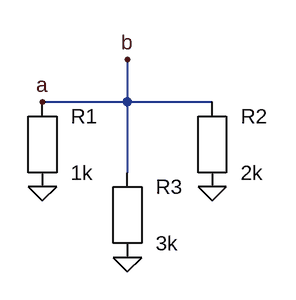
[diagram p0: schematic wire_ends_meeting_on_wire_interior.asc]
wire_ends_meeting_on_wire_interior.asc, the LTspice schematic file:
Version 4
SHEET 1 880 680
WIRE 96 96 288 96
WIRE 192 48 192 96
WIRE 192 96 192 176
SYMBOL res 96 144 R0
SYMATTR InstName R1
SYMATTR Value 1k
SYMBOL res 288 144 R0
SYMATTR InstName R2
SYMATTR Value 2k
FLAG 96 192 0
FLAG 288 192 0
FLAG 96 96 a
FLAG 192 48 b
SYMBOL res 192 224 R0
SYMATTR InstName R3
SYMATTR Value 3k
FLAG 192 272 0

The netlist it stands for:
* wire_ends_meeting_on_wire_interior.asc
R1 b 0 1k
R2 b 0 2k
R3 b 0 3k
.backanno
.end